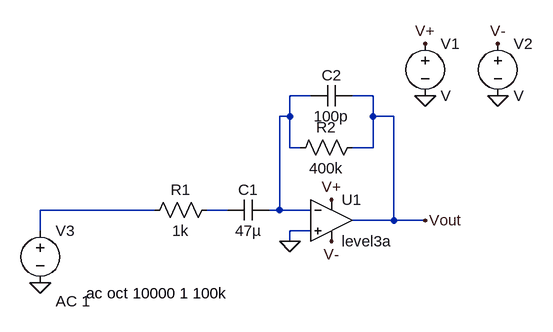
[diagram p0: schematic Draft1.asc]
Draft1.asc, the LTspice schematic file:
Version 4
SHEET 1 880 680
WIRE 96 112 64 112
WIRE 192 112 160 112
WIRE 64 144 64 112
WIRE 64 144 48 144
WIRE 192 144 192 112
WIRE 224 144 192 144
WIRE 64 192 64 144
WIRE 80 192 64 192
WIRE 192 192 192 144
WIRE 192 192 160 192
WIRE -144 288 -320 288
WIRE -32 288 -64 288
WIRE 48 288 48 144
WIRE 48 288 32 288
WIRE 96 288 48 288
WIRE 224 304 224 144
WIRE 224 304 160 304
WIRE 272 304 224 304
WIRE -320 320 -320 288
WIRE 96 320 64 320
WIRE 64 336 64 320
FLAG 384 112 0
FLAG 272 112 0
FLAG 272 32 V+
FLAG 384 32 V-
FLAG 128 272 V+
FLAG 128 336 V-
FLAG 64 336 0
FLAG 272 304 Vout
FLAG -320 400 0
SYMBOL OpAmps\\UniversalOpAmp3 128 304 R0
SYMATTR InstName U1
SYMBOL voltage 272 16 R0
SYMATTR InstName V1
SYMBOL voltage 384 16 R0
SYMATTR InstName V2
SYMBOL cap 32 272 R90
WINDOW 0 0 32 VBottom 2
WINDOW 3 32 32 VTop 2
SYMATTR InstName C1
SYMATTR Value 47µ
SYMBOL res -48 272 R90
WINDOW 0 0 56 VBottom 2
WINDOW 3 32 56 VTop 2
SYMATTR InstName R1
SYMATTR Value 1k
SYMBOL res 176 176 R90
WINDOW 0 0 56 VBottom 2
WINDOW 3 32 56 VTop 2
SYMATTR InstName R2
SYMATTR Value 400k
SYMBOL cap 160 96 R90
WINDOW 0 0 32 VBottom 2
WINDOW 3 32 32 VTop 2
SYMATTR InstName C2
SYMATTR Value 100p
SYMBOL voltage -320 304 R0
WINDOW 123 24 124 Left 2
WINDOW 39 0 0 Left 0
SYMATTR InstName V3
SYMATTR Value ""
SYMATTR Value2 AC 1
TEXT -256 416 Left 2 !.ac oct 10000 1 100k

The netlist it stands for:
* Draft1.asc
XU1 0 N001 V+ V- Vout level3a  ; pins In+ In- V+ V- OUT
V1 V+ 0 V
V2 V- 0 V
C1 N001 N003 47µ
R1 N003 N002 1k
R2 Vout N001 400k
C2 Vout N001 100p
V3 N002 0 AC 1
.ac oct 10000 1 100k
.backanno
.end